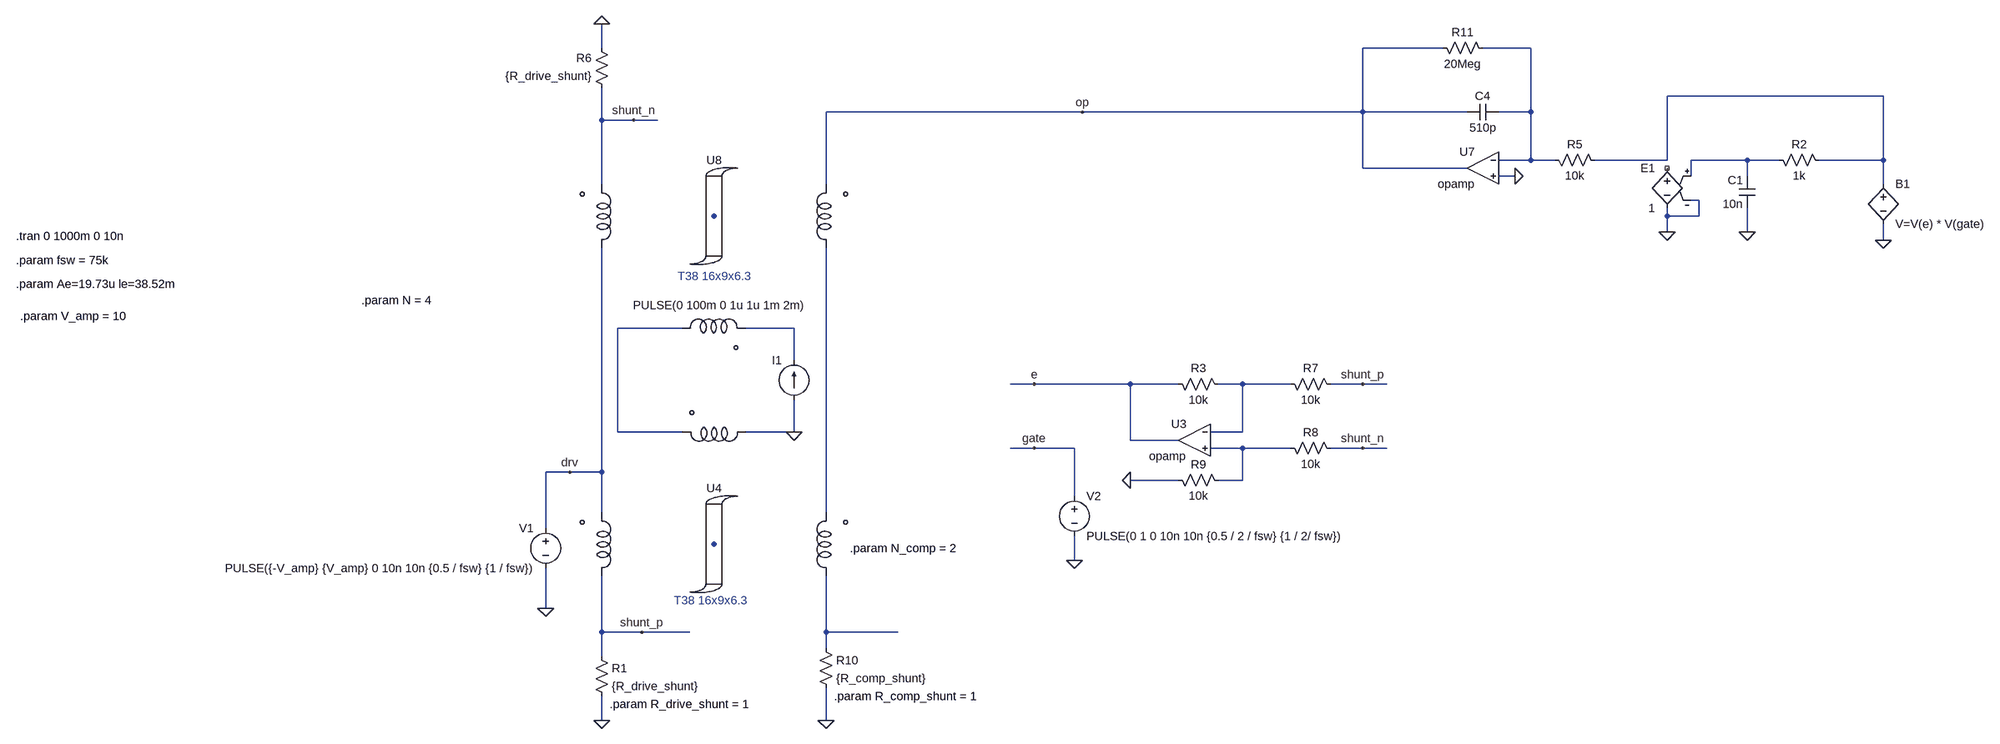
[diagram p0: schematic basic_closed_loop_example_BW.asc]
basic_closed_loop_example_BW.asc, the LTspice schematic file:
Version 4
SHEET 1 3936 1332
WIRE -816 -2800 -816 -2848
WIRE 864 -2800 704 -2800
WIRE 1040 -2800 944 -2800
WIRE 1744 -2704 1312 -2704
WIRE 144 -2672 -368 -2672
WIRE 704 -2672 704 -2800
WIRE 704 -2672 144 -2672
WIRE 912 -2672 704 -2672
WIRE 1040 -2672 1040 -2800
WIRE 1040 -2672 976 -2672
WIRE -816 -2656 -816 -2720
WIRE -752 -2656 -816 -2656
WIRE -704 -2656 -752 -2656
WIRE 1040 -2576 1040 -2672
WIRE 1040 -2576 976 -2576
WIRE 1088 -2576 1040 -2576
WIRE 1312 -2576 1312 -2704
WIRE 1312 -2576 1168 -2576
WIRE 1472 -2576 1360 -2576
WIRE 1536 -2576 1472 -2576
WIRE 1744 -2576 1744 -2704
WIRE 1744 -2576 1616 -2576
WIRE 704 -2560 704 -2672
WIRE 912 -2560 704 -2560
WIRE 1008 -2544 976 -2544
WIRE 1360 -2544 1360 -2576
WIRE 1472 -2544 1472 -2576
WIRE -816 -2528 -816 -2656
WIRE -368 -2528 -368 -2672
WIRE 1744 -2528 1744 -2576
WIRE 1376 -2496 1360 -2496
WIRE 1312 -2464 1312 -2480
WIRE 1376 -2464 1376 -2496
WIRE 1376 -2464 1312 -2464
WIRE 1312 -2432 1312 -2464
WIRE 1472 -2432 1472 -2480
WIRE 1744 -2416 1744 -2448
WIRE -656 -2240 -784 -2240
WIRE -432 -2240 -528 -2240
WIRE -432 -2176 -432 -2240
WIRE 48 -2128 0 -2128
WIRE 240 -2128 48 -2128
WIRE 336 -2128 240 -2128
WIRE 464 -2128 416 -2128
WIRE 560 -2128 464 -2128
WIRE 704 -2128 640 -2128
WIRE 752 -2128 704 -2128
WIRE -784 -2032 -784 -2240
WIRE -656 -2032 -784 -2032
WIRE -432 -2032 -432 -2096
WIRE -432 -2032 -528 -2032
WIRE 464 -2032 464 -2128
WIRE 464 -2032 400 -2032
WIRE 240 -2016 240 -2128
WIRE 336 -2016 240 -2016
WIRE 48 -2000 0 -2000
WIRE 128 -2000 48 -2000
WIRE 464 -2000 400 -2000
WIRE 560 -2000 464 -2000
WIRE 704 -2000 640 -2000
WIRE 752 -2000 704 -2000
WIRE -880 -1952 -928 -1952
WIRE -816 -1952 -816 -2400
WIRE -816 -1952 -880 -1952
WIRE 336 -1936 240 -1936
WIRE 464 -1936 464 -2000
WIRE 464 -1936 416 -1936
WIRE 128 -1904 128 -2000
WIRE -816 -1872 -816 -1952
WIRE -368 -1872 -368 -2400
WIRE -928 -1840 -928 -1952
WIRE 128 -1776 128 -1824
WIRE -928 -1680 -928 -1760
WIRE -816 -1632 -816 -1744
WIRE -736 -1632 -816 -1632
WIRE -640 -1632 -736 -1632
WIRE -368 -1632 -368 -1744
WIRE -224 -1632 -368 -1632
WIRE -368 -1600 -368 -1632
WIRE -816 -1584 -816 -1632
WIRE -816 -1456 -816 -1504
WIRE -368 -1456 -368 -1520
FLAG -928 -1680 0
FLAG 128 -1776 0
FLAG -880 -1952 drv
FLAG -816 -2848 0
FLAG 240 -1936 0
FLAG -736 -1632 shunt_p
FLAG 704 -2128 shunt_p
FLAG 704 -2000 shunt_n
FLAG -752 -2656 shunt_n
FLAG -368 -1456 0
FLAG -816 -1456 0
FLAG 48 -2000 gate
FLAG 48 -2128 e
FLAG 1744 -2416 0
FLAG -432 -2032 0
FLAG 1008 -2544 0
FLAG 144 -2672 op
FLAG 1312 -2432 0
FLAG 1472 -2432 0
SYMBOL voltage -928 -1856 M0
WINDOW 123 0 0 Left 0
WINDOW 39 0 0 Left 0
SYMATTR InstName V1
SYMATTR Value PULSE({-V_amp} {V_amp} 0 10n 10n {0.5 / fsw} {1 / fsw})
SYMBOL Winding -816 -1808 R0
WINDOW 0 -93 39 Invisible 2
WINDOW 39 -225 76 Invisible 2
WINDOW 3 -98 42 Invisible 2
SYMATTR InstName U1
SYMATTR SpiceLine n={N} L=10n Rs=1m Rp=100Meg
SYMBOL Core_Chan -592 -1808 R0
WINDOW 3 41 88 Invisible 2
WINDOW 39 13 112 Invisible 2
WINDOW 0 1 -96 Bottom 2
SYMATTR SpiceLine Bs=0.43 Br=0.1 Hc=8
SYMATTR InstName U4
SYMATTR SpiceLine2 A={Ae} Lm={le} Lg=0 Rp=1Meg
SYMBOL res -832 -1600 R0
SYMATTR InstName R1
SYMATTR Value {R_drive_shunt}
SYMBOL Winding -592 -2032 M90
WINDOW 0 -93 39 Invisible 2
WINDOW 39 -196 73 Invisible 2
WINDOW 3 -98 42 Invisible 2
SYMATTR InstName U2
SYMATTR SpiceLine n={1} L=10n Rs=1m Rp=100k
SYMBOL current -432 -2096 R180
WINDOW 0 24 80 Left 2
WINDOW 3 149 190 Center 2
WINDOW 123 0 0 Left 0
WINDOW 39 0 0 Left 0
SYMATTR InstName I1
SYMATTR Value PULSE(0 100m 0 1u 1u 1m 2m)
SYMBOL voltage 128 -1920 R0
WINDOW 123 0 0 Left 0
WINDOW 39 0 0 Left 0
SYMATTR InstName V2
SYMATTR Value PULSE(0 1 0 10n 10n {0.5 / 2 / fsw} {1 / 2/ fsw})
SYMBOL opamp 944 -2624 M0
SYMATTR InstName U7
SYMATTR SpiceLine2 GBW=1000Meg
SYMBOL Winding -816 -2464 R0
WINDOW 0 221 26 Invisible 2
WINDOW 39 259 -62 Invisible 2
WINDOW 3 214 -32 Invisible 2
SYMATTR InstName U6
SYMATTR SpiceLine n={N} L=10n Rs=1m Rp=100Meg
SYMBOL Core_Chan -592 -2464 R0
WINDOW 3 41 88 Invisible 2
WINDOW 39 13 112 Invisible 2
WINDOW 0 1 -96 Bottom 2
SYMATTR SpiceLine Bs=0.43 Br=0.1 Hc=8
SYMATTR InstName U8
SYMATTR SpiceLine2 A={Ae} Lm={le} Lg=0 Rp=1Meg
SYMBOL res -800 -2704 R180
WINDOW 0 36 76 Left 2
WINDOW 3 36 40 Left 2
SYMATTR InstName R6
SYMATTR Value {R_drive_shunt}
SYMBOL Winding -592 -2240 M270
WINDOW 0 -93 39 Invisible 2
WINDOW 39 -196 73 Invisible 2
WINDOW 3 -98 42 Invisible 2
SYMATTR InstName U9
SYMATTR SpiceLine n={1} L=10n Rs=1m Rp=100k
SYMBOL opamp 368 -2080 M0
SYMATTR InstName U3
SYMBOL res 320 -2144 M90
WINDOW 0 0 56 VBottom 2
WINDOW 3 32 56 VTop 2
SYMATTR InstName R3
SYMATTR Value 10k
SYMBOL res 544 -2144 M90
WINDOW 0 0 56 VBottom 2
WINDOW 3 32 56 VTop 2
SYMATTR InstName R7
SYMATTR Value 10k
SYMBOL res 544 -2016 M90
WINDOW 0 0 56 VBottom 2
WINDOW 3 32 56 VTop 2
SYMATTR InstName R8
SYMATTR Value 10k
SYMBOL res 320 -1952 M90
WINDOW 0 0 56 VBottom 2
WINDOW 3 32 56 VTop 2
SYMATTR InstName R9
SYMATTR Value 10k
SYMBOL Winding -368 -1808 M0
WINDOW 0 -93 39 Invisible 2
WINDOW 39 -225 76 Invisible 2
WINDOW 3 -98 42 Invisible 2
SYMATTR InstName U10
SYMATTR SpiceLine n={N_comp} L=10n Rs=1m Rp=100Meg
SYMBOL Winding -368 -2464 M0
WINDOW 0 221 26 Invisible 2
WINDOW 39 259 -62 Invisible 2
WINDOW 3 214 -32 Invisible 2
SYMATTR InstName U11
SYMATTR SpiceLine n={N_comp} L=10n Rs=1m Rp=100Meg
SYMBOL res -384 -1616 R0
SYMATTR InstName R10
SYMATTR Value {R_comp_shunt}
SYMBOL bv 1744 -2544 R0
SYMATTR InstName B1
SYMATTR Value V=V(e) * V(gate)
SYMBOL res 1072 -2592 M90
WINDOW 0 0 56 VBottom 2
WINDOW 3 32 56 VTop 2
SYMATTR InstName R5
SYMATTR Value 10k
SYMBOL cap 976 -2688 R90
WINDOW 0 0 32 VBottom 2
WINDOW 3 32 32 VTop 2
SYMATTR InstName C4
SYMATTR Value 510p
SYMBOL e 1312 -2576 M0
SYMATTR InstName E1
SYMATTR Value 1
SYMBOL res 1520 -2592 M90
WINDOW 0 0 56 VBottom 2
WINDOW 3 32 56 VTop 2
SYMATTR InstName R2
SYMATTR Value 1k
SYMBOL cap 1488 -2480 R180
WINDOW 0 24 56 Left 2
WINDOW 3 24 8 Left 2
SYMATTR InstName C1
SYMATTR Value 10n
SYMBOL res 848 -2816 M90
WINDOW 0 0 56 VBottom 2
WINDOW 3 32 56 VTop 2
SYMATTR InstName R11
SYMATTR Value 20Meg
TEXT -2856 -2424 Left 2 !.tran 0 1000m 0 10n
TEXT -2856 -2328 Left 2 !.param Ae=19.73u le=38.52m
TEXT -2856 -2376 Left 2 !.param fsw = 75k
TEXT -2848 -2264 Left 2 !.param V_amp = 10
TEXT -672 -1696 Left 2 ;T38 16x9x6.3
TEXT -320 -1800 Left 2 !.param N_comp = 2
TEXT -664 -2344 Left 2 ;T38 16x9x6.3
TEXT -1296 -2296 Left 2 !.param N = 4
TEXT -800 -1488 Left 2 !.param R_drive_shunt = 1
TEXT -352 -1504 Left 2 !.param R_comp_shunt = 1

The netlist it stands for:
* basic_closed_loop_example_BW.asc
V1 drv 0 PULSE({-V_amp} {V_amp} 0 10n 10n {0.5 / fsw} {1 / fsw})
XU1 shunt_p drv P001 Winding n={N} L=10n Rs=1m Rp=100Meg  ; pins s f c
XU4 P001 Core_Chan Bs=0.43 Br=0.1 Hc=8 A={Ae} Lm={le} Lg=0 Rp=1Meg  ; pins C
R1 shunt_p 0 {R_drive_shunt}
XU2 0 N004 P001 Winding n={1} L=10n Rs=1m Rp=100k  ; pins s f c
I1 0 N005 PULSE(0 100m 0 1u 1u 1m 2m)
V2 gate 0 PULSE(0 1 0 10n 10n {0.5 / 2 / fsw} {1 / 2/ fsw})
XU7 N001 0 op opamp Aol=100K GBW=1000Meg  ; pins invin noninvin out
XU6 drv shunt_n P002 Winding n={N} L=10n Rs=1m Rp=100Meg  ; pins s f c
XU8 P002 Core_Chan Bs=0.43 Br=0.1 Hc=8 A={Ae} Lm={le} Lg=0 Rp=1Meg  ; pins C
R6 shunt_n 0 {R_drive_shunt}
XU9 N004 N005 P002 Winding n={1} L=10n Rs=1m Rp=100k  ; pins s f c
XU3 N006 N007 e opamp Aol=100K GBW=10Meg  ; pins invin noninvin out
R3 e N006 10k
R7 N006 shunt_p 10k
R8 N007 shunt_n 10k
R9 0 N007 10k
XU10 N009 N008 P001 Winding n={N_comp} L=10n Rs=1m Rp=100Meg  ; pins s f c
XU11 N008 op P002 Winding n={N_comp} L=10n Rs=1m Rp=100Meg  ; pins s f c
R10 N009 0 {R_comp_shunt}
B1 N002 0 V=V(e) * V(gate)
R5 N001 N002 10k
C4 N001 op 510p
E1 NC_01 0 N003 0 1
R2 N003 N002 1k
C1 0 N003 10n
R11 op N001 20Meg
.tran 0 1000m 0 10n
.param Ae=19.73u le=38.52m
.param fsw = 75k
.param V_amp = 10
* T38 16x9x6.3
.param N_comp = 2
* T38 16x9x6.3
.param N = 4
.param R_drive_shunt = 1
.param R_comp_shunt = 1
.lib Winding.lib
.lib Core_Chan.lib
.backanno
.end